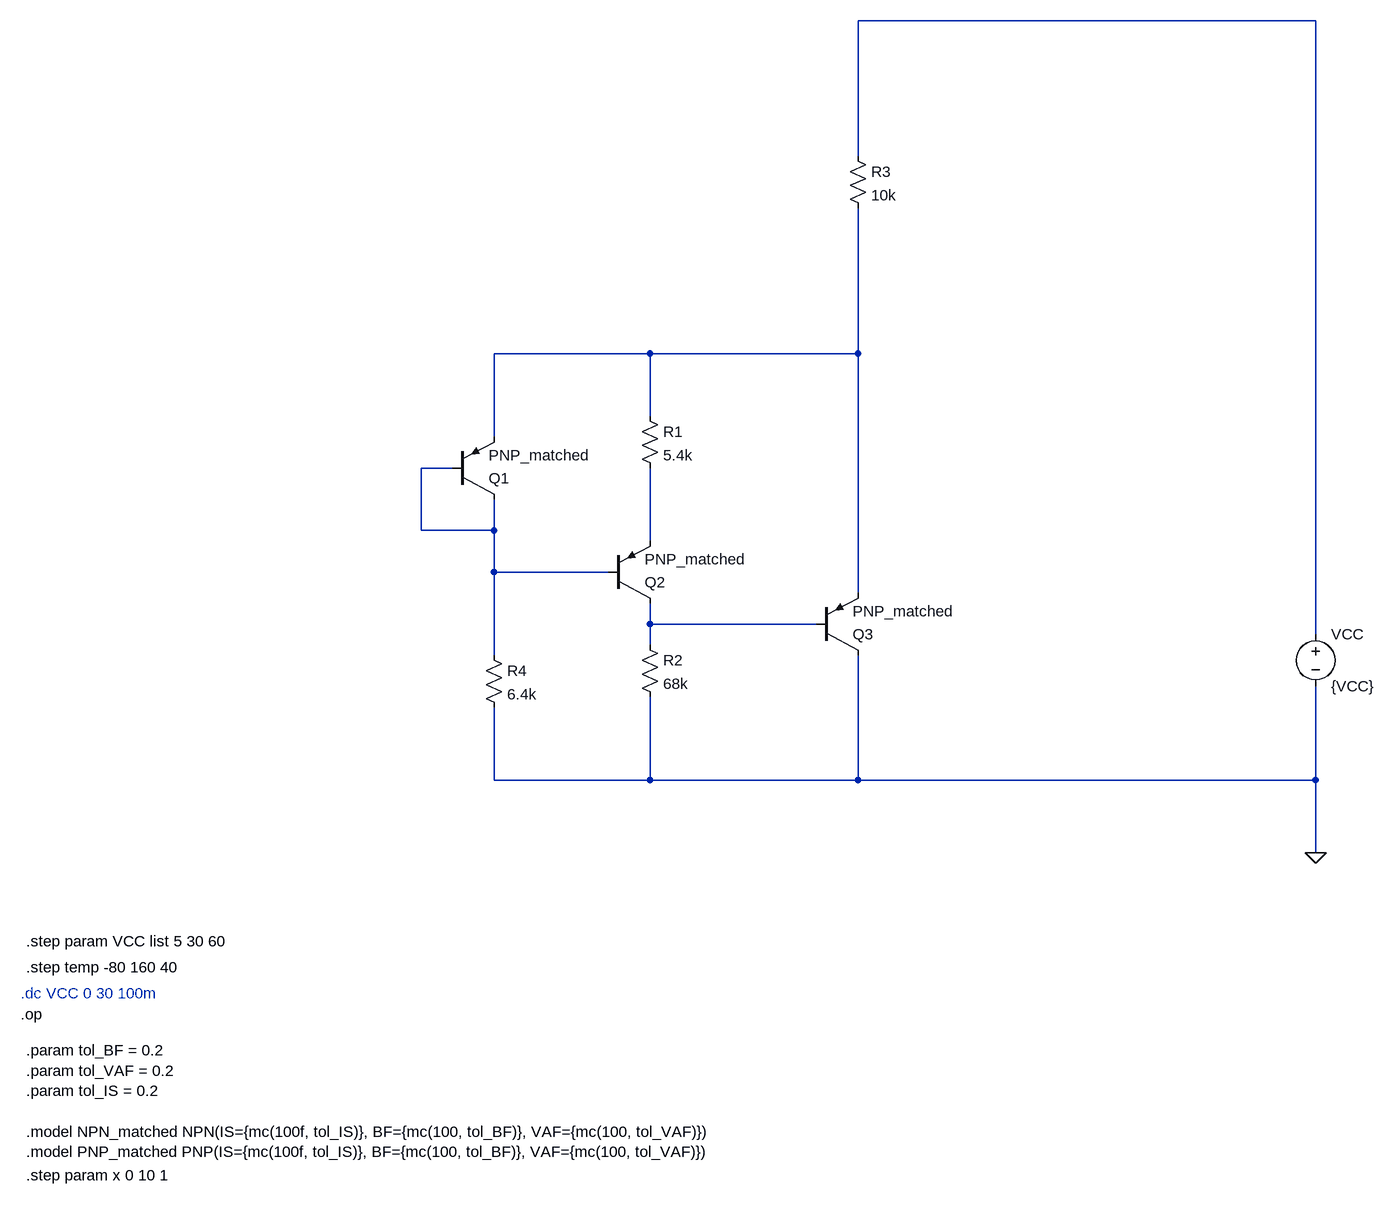
[diagram p0: schematic Widlar_Bandgap_Voltage_Reference.asc]
Widlar_Bandgap_Voltage_Reference.asc, the LTspice schematic file:
Version 4.1
SHEET 1 2084 912
WIRE 1984 -880 1280 -880
WIRE 1280 -672 1280 -880
WIRE 960 -368 720 -368
WIRE 1280 -368 1280 -592
WIRE 1280 -368 960 -368
WIRE 960 -272 960 -368
WIRE 720 -240 720 -368
WIRE 656 -192 608 -192
WIRE 608 -96 608 -192
WIRE 720 -96 720 -144
WIRE 720 -96 608 -96
WIRE 960 -80 960 -192
WIRE 720 -32 720 -96
WIRE 896 -32 720 -32
WIRE 1280 0 1280 -368
WIRE 960 48 960 16
WIRE 1216 48 960 48
WIRE 1984 64 1984 -880
WIRE 960 80 960 48
WIRE 720 96 720 -32
WIRE 720 288 720 176
WIRE 960 288 960 160
WIRE 960 288 720 288
WIRE 1280 288 1280 96
WIRE 1280 288 960 288
WIRE 1984 288 1984 144
WIRE 1984 288 1280 288
WIRE 1984 400 1984 288
FLAG 1984 400 0
SYMBOL voltage 1984 48 R0
WINDOW 123 0 0 Left 0
WINDOW 39 0 0 Left 0
SYMATTR InstName VCC
SYMATTR Value {VCC}
SYMBOL res 944 -288 R0
SYMATTR InstName R1
SYMATTR Value 5.4k
SYMBOL res 944 64 R0
SYMATTR InstName R2
SYMATTR Value 68k
SYMBOL res 704 80 R0
SYMATTR InstName R4
SYMATTR Value 6.4k
SYMBOL res 1264 -688 R0
SYMATTR InstName R3
SYMATTR Value 10k
SYMBOL pnp 656 -144 M180
SYMATTR InstName Q1
SYMATTR Value PNP_matched
SYMBOL pnp 896 16 M180
SYMATTR InstName Q2
SYMATTR Value PNP_matched
SYMBOL pnp 1216 96 M180
SYMATTR InstName Q3
SYMATTR Value PNP_matched
TEXT -8 616 Left 2 ;.dc VCC 0 30 100m
TEXT 0 576 Left 2 !.step temp -80 160 40
TEXT 0 704 Left 2 !.param tol_BF = 0.2\n.param tol_VAF = 0.2\n.param tol_IS = 0.2\n \n.model NPN_matched NPN(IS={mc(100f, tol_IS)}, BF={mc(100, tol_BF)}, VAF={mc(100, tol_VAF)})\n.model PNP_matched PNP(IS={mc(100f, tol_IS)}, BF={mc(100, tol_BF)}, VAF={mc(100, tol_VAF)})
TEXT 0 896 Left 2 !.step param x 0 10 1
TEXT -8 648 Left 2 !.op
TEXT 0 536 Left 2 !.step param VCC list 5 30 60

The netlist it stands for:
* Widlar_Bandgap_Voltage_Reference.asc
VCC N001 0 {VCC}
R1 N002 N004 5.4k
R2 N005 0 68k
R4 N003 0 6.4k
R3 N001 N002 10k
Q1 N003 N003 N002 0 PNP_matched
Q2 N005 N003 N004 0 PNP_matched
Q3 0 N005 N002 0 PNP_matched
.model NPN NPN
.model PNP PNP
.lib standard.bjt
* .dc VCC 0 30 100m
.step temp -80 160 40
.param tol_BF = 0.2
.param tol_VAF = 0.2
.param tol_IS = 0.2
.model NPN_matched NPN(IS={mc(100f, tol_IS)}, BF={mc(100, tol_BF)}, VAF={mc(100, tol_VAF)})
.model PNP_matched PNP(IS={mc(100f, tol_IS)}, BF={mc(100, tol_BF)}, VAF={mc(100, tol_VAF)})
.step param x 0 10 1
.op
.step param VCC list 5 30 60
.backanno
.end